# Altium schematic sheet LED-DRIVER.SchDoc
size A4; SheetNumber: 8; SheetTotal: 8
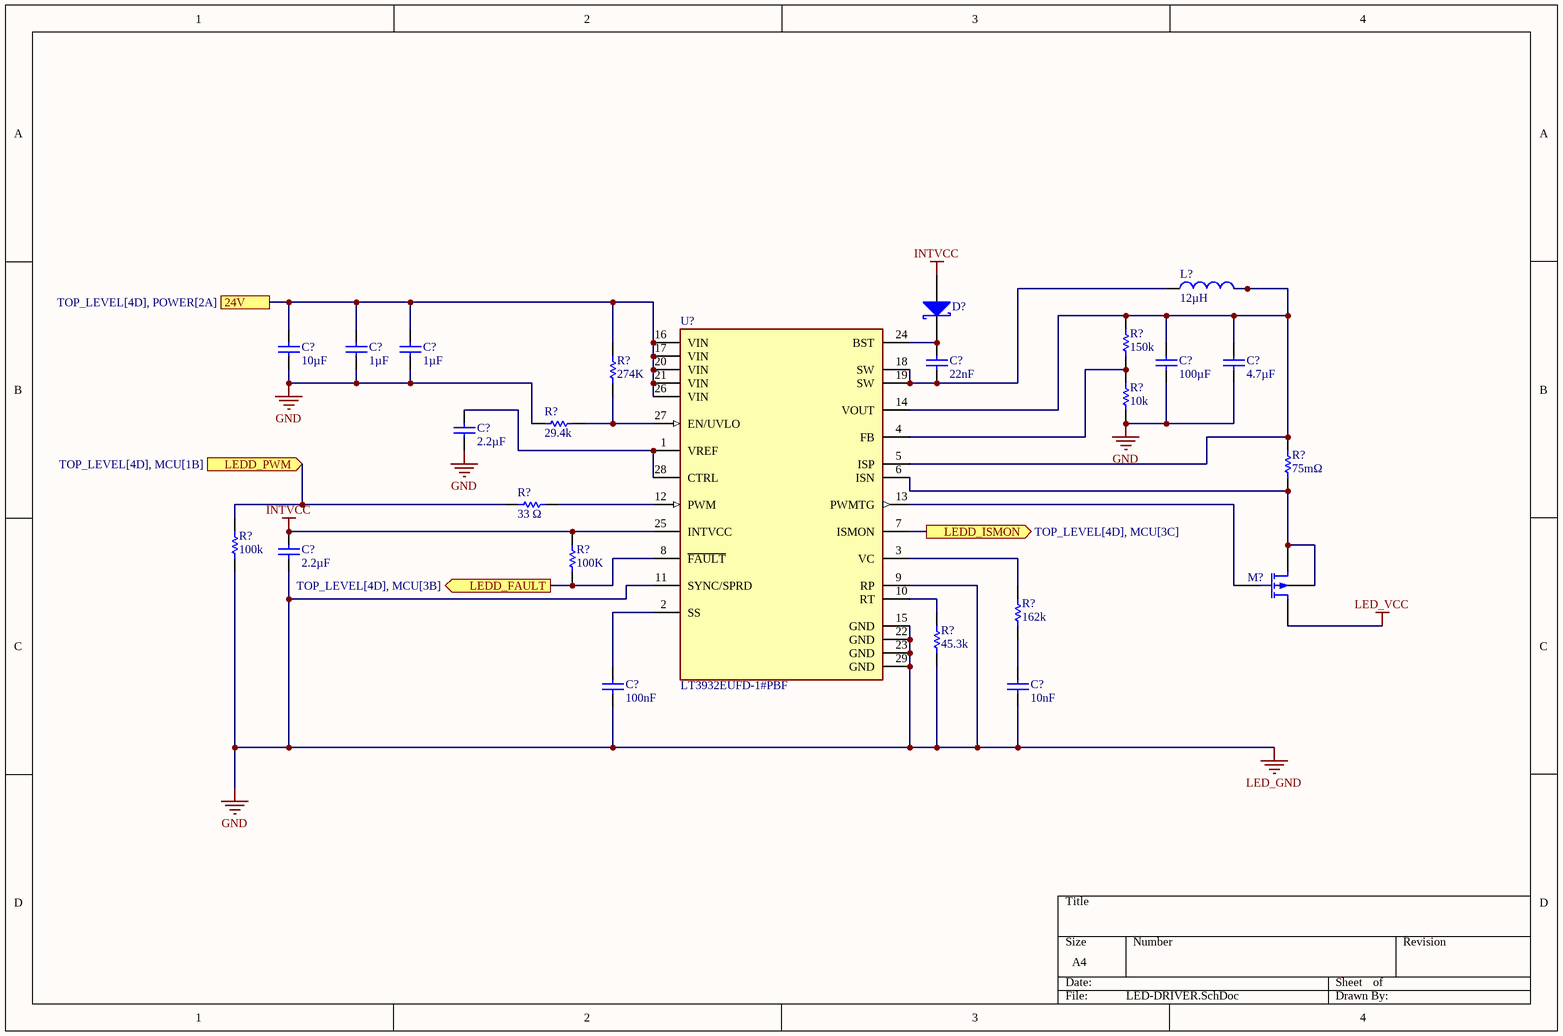
[diagram p0: LED-DRIVER.SchDoc]

## Parts
(Parts that share a designator on the sheet are numbered #1, #2 ... from top to bottom, then left to right.)
C?#1  value 10µF  (hidden comment: Capacitor)
C?#2  value 1µF  (hidden comment: Capacitor)
C?#3  value 1µF  (hidden comment: Capacitor)
C?#4  value 22nF  (hidden comment: Capacitor)
C?#5  value 100µF  (hidden comment: Capacitor)
C?#6  value 4.7µF  (hidden comment: Capacitor)
C?#7  value 2.2µF  (hidden comment: Capacitor)
C?#8  value 2.2µF  (hidden comment: Capacitor)
C?#9  value 100nF  (hidden comment: Capacitor)
C?#10  value 10nF  (hidden comment: Capacitor)
D?  BAT46WJ,115  (value not drawn)
L?  value 12µH  (hidden comment: Inductor)
M?  DMP3045LFVWQ-7  (value not drawn)
R?#1  value 150k  (hidden comment: Resistor)
R?#2  value 274K  (hidden comment: Resistor)
R?#3  value 29.4k  (hidden comment: Resistor)
R?#4  value 10k  (hidden comment: Resistor)
R?#5  value 75mΩ  (hidden comment: Resistor)
R?#6  value 33 Ω  (hidden comment: Resistor)
R?#7  value 100k  (hidden comment: Resistor)
R?#8  value 100K  (hidden comment: Resistor)
R?#9  value 162k  (hidden comment: Resistor)
R?#10  value 45.3k  (hidden comment: Resistor)
U?  LT3932EUFD-1#PBF  [FP-UFD-28-05-08-1712-IPC_C]

## Ports
24V (see TOP_LEVEL[4D], POWER[2A]), LEDD_FAULT (out, see TOP_LEVEL[4D], MCU[3B]), LEDD_ISMON (out, see TOP_LEVEL[4D], MCU[3C]), LEDD_PWM (in, see TOP_LEVEL[4D], MCU[1B])

## Nets
GND: C?#1.2 C?#2.2 C?#3.2 C?#5.2 C?#6.2 C?#7.2 C?#8.2 C?#9.2 C?#10.2 R?#3.2 R?#4.1 R?#7.2 R?#10.1 U?.9(RP) U?.11(SYNC/SPRD) U?.15(GND) U?.22(GND) U?.23(GND) U?.29(GND)  [also labelled LED_GND]
INTVCC: C?#8.1 D?.1(A) R?#8.2 U?.25(INTVCC)
LED_VCC: M?.3(S)
24V: C?#1.1 C?#2.1 C?#3.1 R?#2.2 U?.16(VIN) U?.17(VIN) U?.20(VIN) U?.21(VIN) U?.26(VIN) ; port 24V
LEDD_FAULT: R?#8.1 U?.8(~{FAULT}) ; port LEDD_FAULT
LEDD_ISMON: U?.7(ISMON) ; port LEDD_ISMON
LEDD_PWM: R?#6.1 R?#7.1 ; port LEDD_PWM
NetC?#4_1: C?#4.1 D?.2(K) U?.24(BST)
NetC?#4_2: C?#4.2 L?.1 U?.18(SW) U?.19(SW)
NetC?#5_1: C?#5.1 C?#6.1 L?.2 R?#1.2 R?#5.2 U?.5(ISP) U?.14(VOUT)
NetC?#7_1: C?#7.1 U?.1(VREF) U?.28(CTRL)
NetC?#9_1: C?#9.1 U?.2(SS)
NetC?#10_1: C?#10.1 R?#9.1
NetM?_1: M?.1(D) M?.4(B) R?#5.1 U?.6(ISN)
NetM?_2: M?.2(G) U?.13(PWMTG)
NetR?#1_1: R?#1.1 R?#4.2 U?.4(FB)
NetR?#2_1: R?#2.1 R?#3.1 U?.27(EN/UVLO)
NetR?#6_2: R?#6.2 U?.12(PWM)
NetR?#9_2: R?#9.2 U?.3(VC)
NetR?#10_2: R?#10.2 U?.10(RT)

## Library data of the parts
C?#1-C?#10 = Capacitor: SimulationGenericComponent: True
D? = Schottky Diode: AF: 1; BV: 0; BV_MAX: 1e99; EG: 1.11; FC: 0.5; IBV: 0.001; IS: 1e-14; MJSW: 0.33; NTUN: 30; TNOM: 27; XTI: 3; SimulationGenericComponent: True; CJO: 0; CJP: 0; CTA: 0; CTP: 0; FCS: 0.5; FV_MAX: 1e99; IKF: 0; IKR: 0; ISR: 1e-14; JSW: 0; JTUN: 0; JTUNSW: 0; KEG: 1; KF: 0; LEVEL: 1; N: 1; NBV: 1; NR: 1; NS: 1; PHP: 1; RS: 0; TCV: 0; TLEV: 0; TLEVC: 0; TM1: 0; TM2: 0; TPB: 0; TPHP: 0; TRS: 0; TRS2: 0; TT: 0; TTT1: 0; TTT2: 0; VJ: 1; XTITUN: 3
L? = Inductor: SimulationGenericComponent: True
M? = MOSFET P-ch Lev1: P-channel MOS1 MOSFET Shichman and Hodges Model; CBD: 0; FC: 0.5; IS: 1e-14; KP: 2e-05; PB: 0.8; PHI: 0.6; TNOM: 27; SimulationGenericComponent: True; CBS: 0; CGBO: 0; CGDO: 0; CGSO: 0; CJ: 0; CJSW: 0; GAMMA: 0; JS: 0; LAMBDA: 0; LD: 0; MJ: 0.5; MJSW: 0.5; NSS: 0; NSUB: 0; RD: 0; RS: 0; RSH: 0; TOX: 0; TPG: 0; U0: 0; VTO: 0
R?#1-R?#10 = Resistor: TC1: 0; SimulationGenericComponent: True; TC2: 0
U? = CMP-09135-000017-1: 40V, 2A MONOLITHIC SYNCHRONOUS S; RoHS Compliant: Yes